# Altium schematic sheet Board3ph.SchDoc
size 594 x 420 mm; DrawnBy: A.C; Address1: WATTNOW Rue Lac Victoria; Address2: Les Berges du Lac, Tunisia.; Revision: B; SheetNumber: 1; SheetTotal: 1; EDA_Number: WN-XXXXX-VX-X; Projet: AC Energy Meter; ModifiedBy: -; CreateDate: 07/05/2020; CheckedDate: -; Title2: Daughter Board B; DivGrp: WN; Designer: A.C
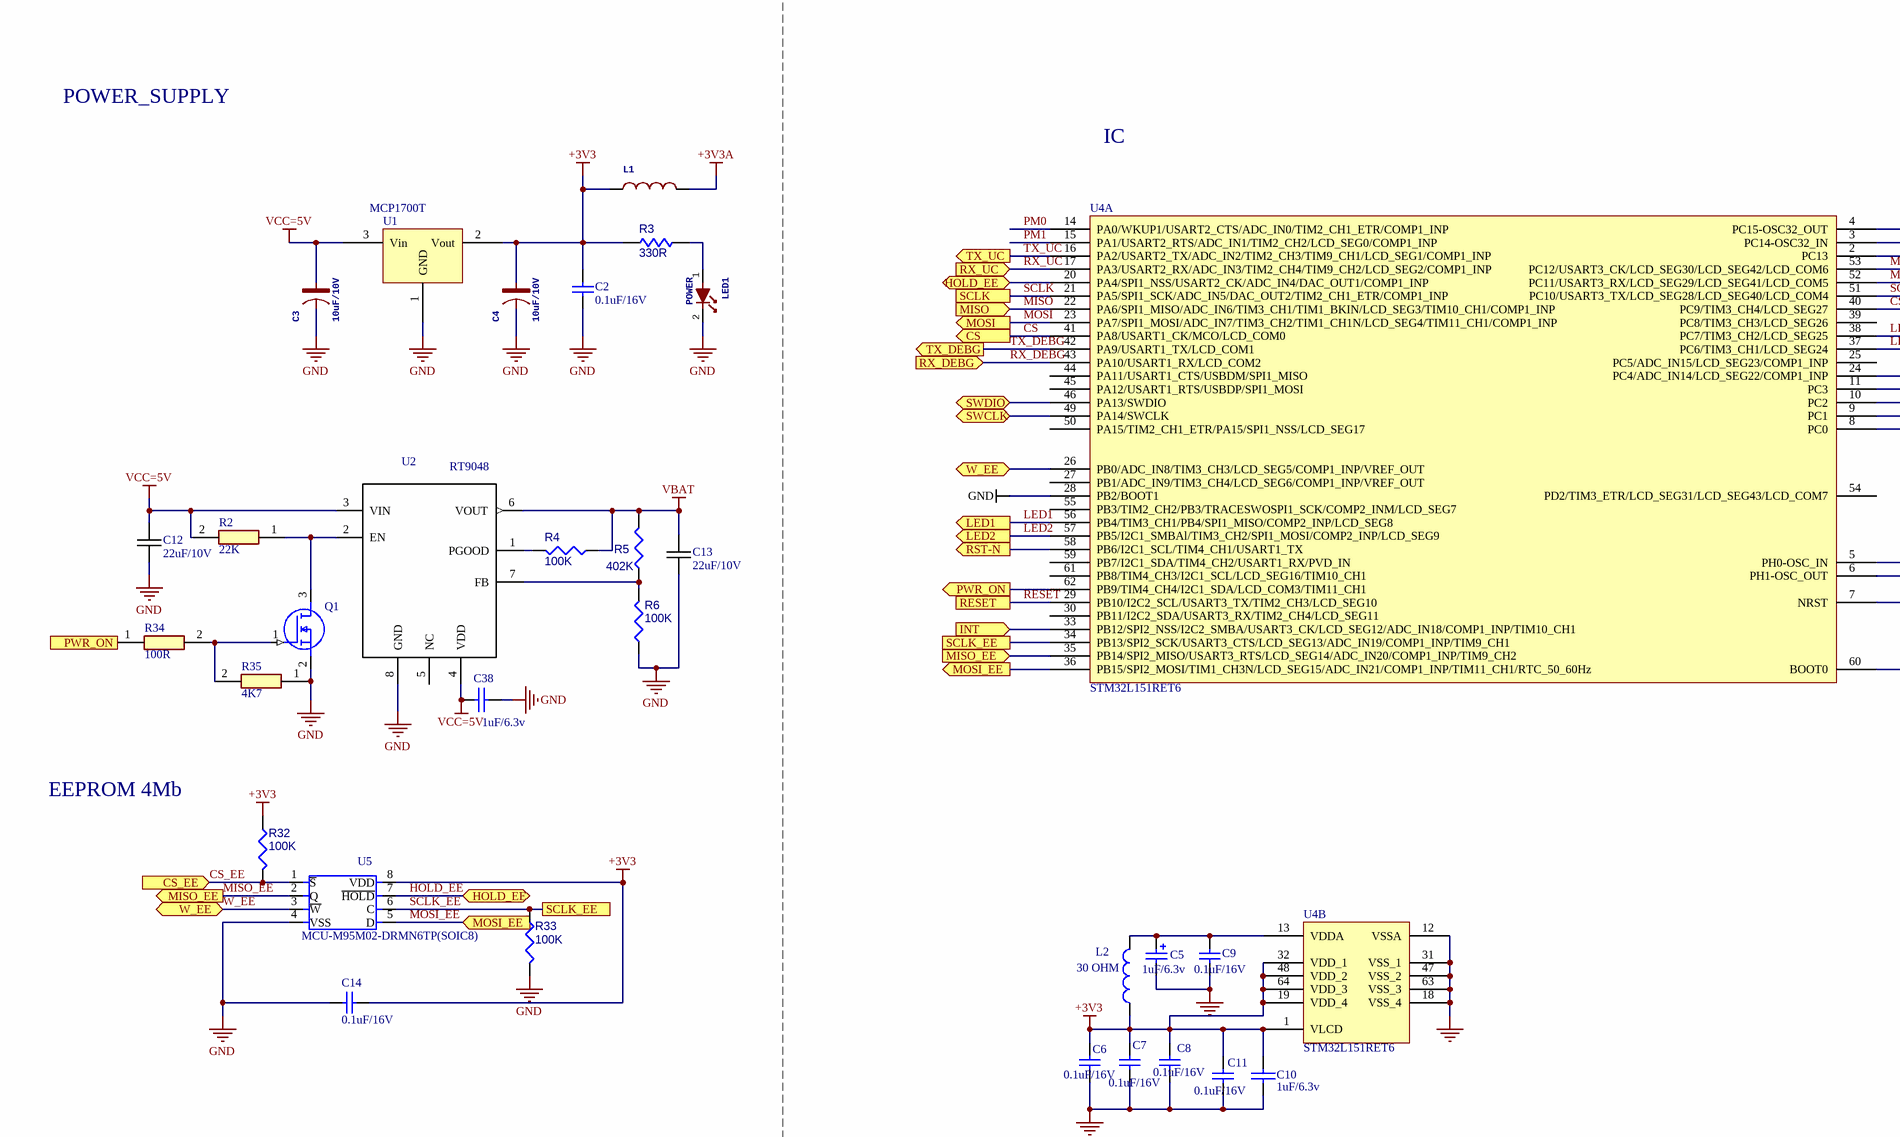
[diagram p0: Board3ph.SchDoc, top left]
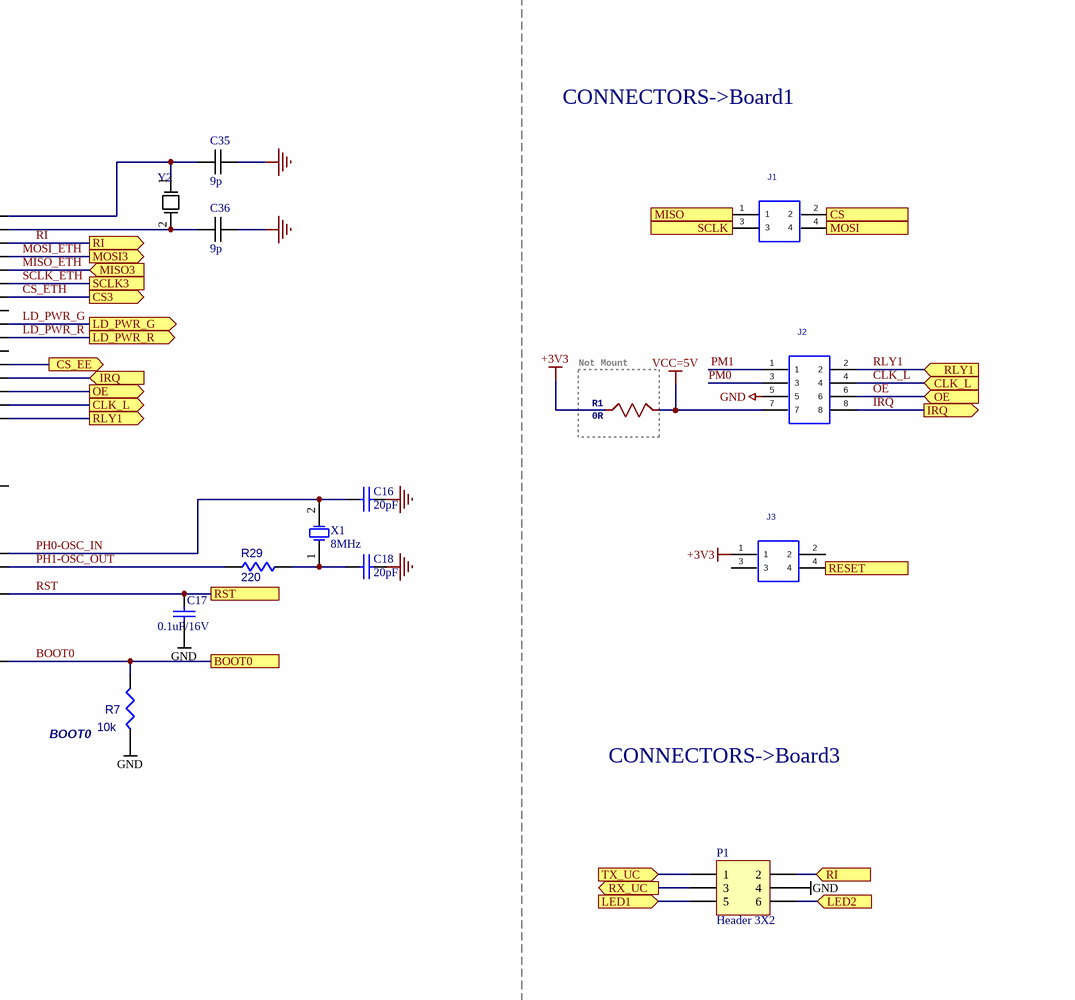
[diagram p1: Board3ph.SchDoc, top right]
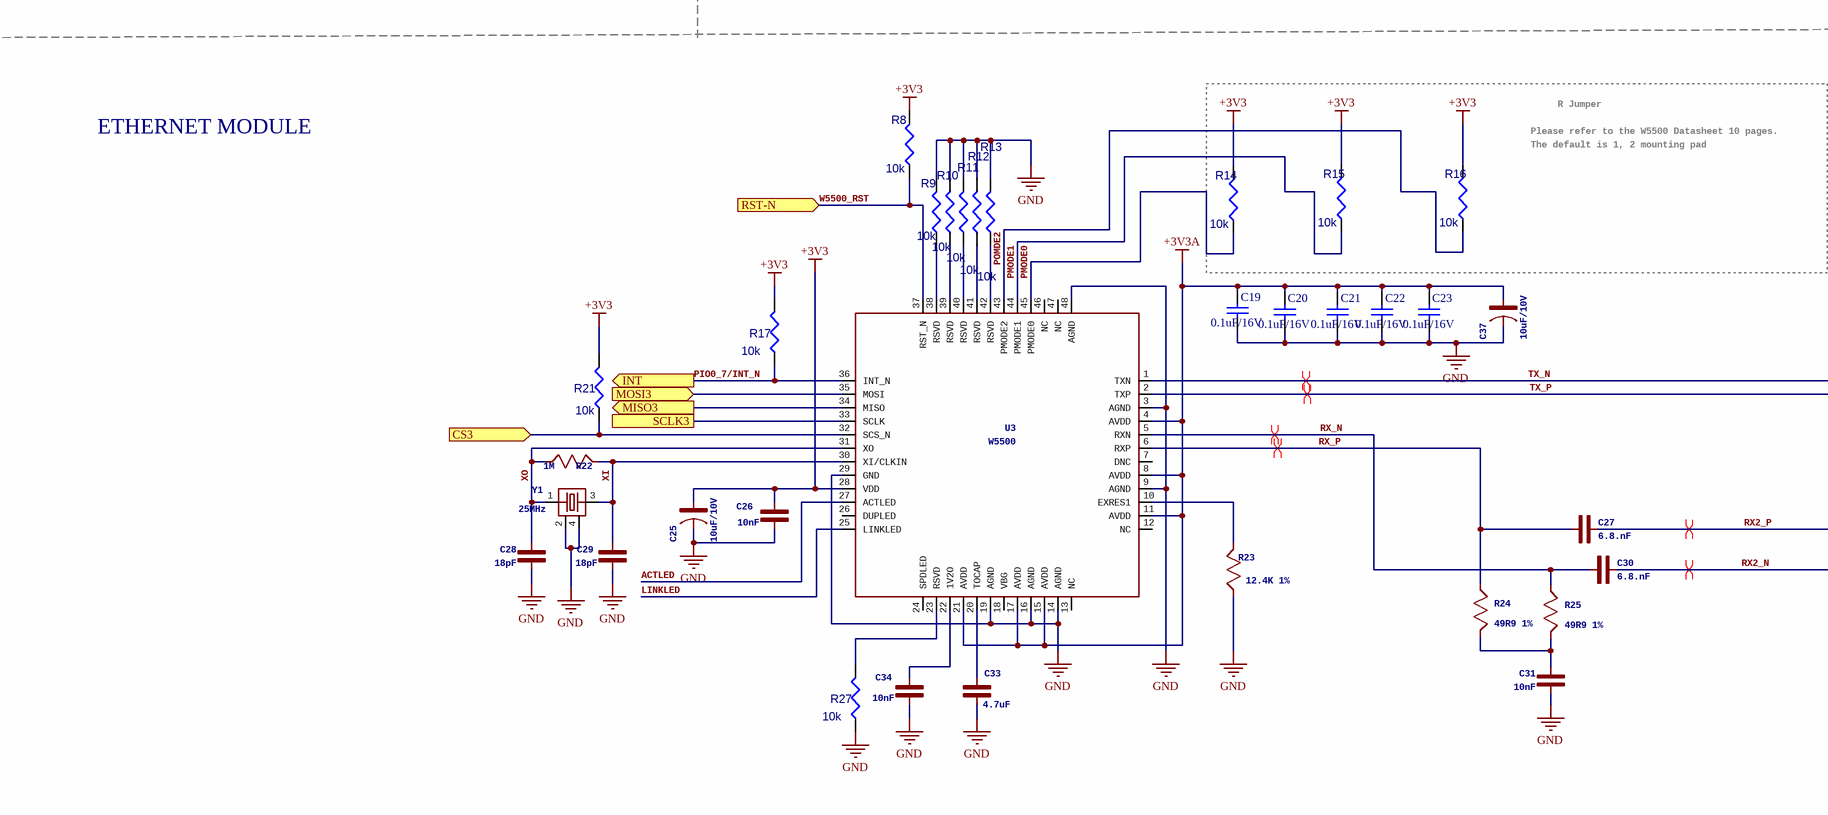
[diagram p2: Board3ph.SchDoc, bottom left]
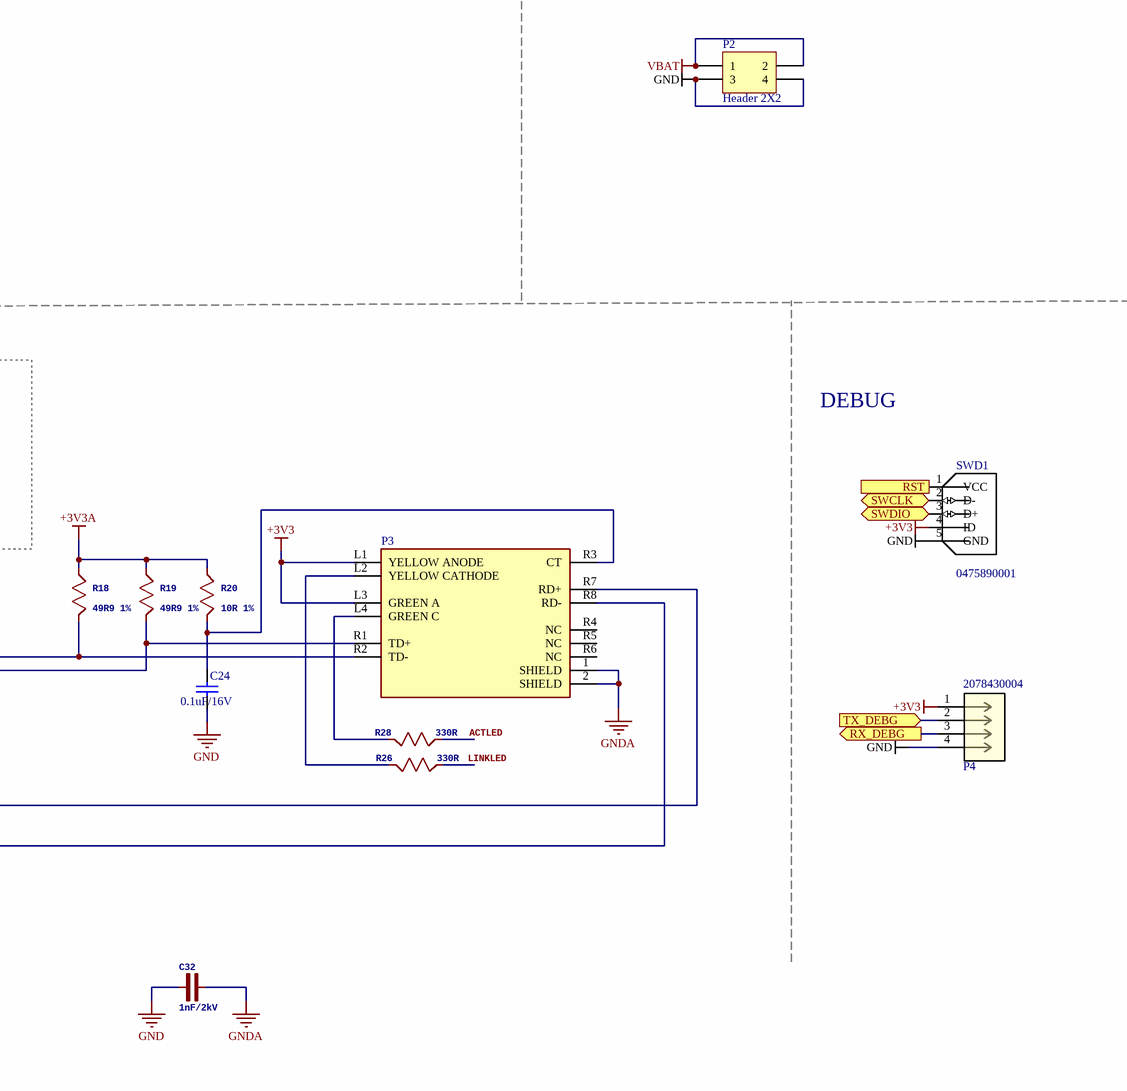
[diagram p3: Board3ph.SchDoc, bottom right]

## Parts
C2  0.1uF/16V  [0603C-TBD]
C3  10uF/10V  [C-3216(TANTAL) - INV]
C4  10uF/10V  [C-3216(TANTAL) - INV]
C5  1uF/6.3v  [C-2012 - TANT]
C6  0.1uF/16V  [0603C-TBD]
C7  0.1uF/16V  [0603C-TBD]
C8  0.1uF/16V  [0603C-TBD]
C9  0.1uF/16V  [0603C-TBD]
C10  1uF/6.3v  [0603C-TBD]
C11  0.1uF/16V  [0603C-TBD]
C12  22uF/10V  [C-3216(TANTAL)]
C13  22uF/10V  [C-3216(TANTAL)]
C14  0.1uF/16V  [0603C-TBD]
C16  20pF  [0603C-TBD]
C17  0.1uF/16V  [0603C-TBD]
C18  20pF  [0603C-TBD]
C19  0.1uF/16V  [0603C-TBD]
C20  0.1uF/16V  [0603C-TBD]
C21  0.1uF/16V  [0603C-TBD]
C22  0.1uF/16V  [0603C-TBD]
C23  0.1uF/16V  [0603C-TBD]
C24  0.1uF/16V  [0603C-TBD]
C25  10uF/10V  [C-3216(TANTAL)]
C26  10nF  [C-1608]
C27  6.8.nF  [C-1608]
C28  18pF  [C-1608]
C29  18pF  [C-1608]
C30  6.8.nF  [C-1608]
C31  10nF  [C-1608]
C32  1nF/2kV  [C-2012]
C33  4.7uF  [0603C-TBD]
C34  10nF  [C-1608]
C35  9p  [0603C-TBD]
C36  9p  [0603C-TBD]
C37  10uF/10V  [C-3216(TANTAL)]
C38  1uF/6.3v  [0603C-TBD]
J1  SFMC-102-X1-XX-D  [SFMC-102-X1-XX-D]  (value not drawn)
J2  SFMC-104-X1-XX-D  [SFMC-104-X1-XX-D]  (value not drawn)
J3  SFMC-102-X1-XX-D  [SFMC-102-X1-XX-D]  (value not drawn)
L1  GLFR1608T1R5M-LR  [L-1608]  (value not drawn)
L2  30 OHM  [0603C-TBD]
LED1  POWER  [LED-1608]
P1  Header 3X2  [3x2A 1.27 Double Samtec]
P2  Header 2X2  [2x2A 1.27 Double Samtec]
P3  Conn_WIZnet_RB1-125BAG1A_eec  [WIZnet_RB1-125BAG1A_0]  (value not drawn)
P4  2078430004  [CON_2078430004_MOL]
Q1  2N7002  [SOT23]  (value not drawn)
R1  0R  [R-1608]
R2  22K  [0603C-TBD]
R3  330R  [0603C-TBD]
R4  100K  [0603C-TBD]
R5  402K  [0603C-TBD]
R6  100K  [0603C-TBD]
R7  10k  [0603C-TBD]
R8  10k  [0603C-TBD]
R9  10k  [0603C-TBD]
R10  10k  [0603C-TBD]
R11  10k  [0603C-TBD]
R12  10k  [0603C-TBD]
R13  10k  [0603C-TBD]
R14  10k  [0603C-TBD]
R15  10k  [0603C-TBD]
R16  10k  [0603C-TBD]
R17  10k  [0603C-TBD]
R18  49R9 1%  [R-1608]
R19  49R9 1%  [R-1608]
R20  10R 1%  [R-1608]
R21  10k  [0603C-TBD]
R22  1M  [R-1608]
R23  12.4K 1%  [R-1608]
R24  49R9 1%  [R-1608]
R25  49R9 1%  [R-1608]
R26  330R  [R-1608]
R27  10k  [0603C-TBD]
R28  330R  [R-1608]
R29  220  [0603C-TBD]
R32  100K  [0603C-TBD]
R33  100K  [0603C-TBD]
R34  100R  [0603C-TBD]
R35  4K7  [0603C-TBD]
SWD1  0475890001  [MOLEX_0475890001]
U1  MCP1700T  [SOT23]
U2  RT9048  [SOIC127P600X175-8N]
U3  W5500  [W5500]
U4  STM32L151RET6  [STM-LQFP64_V]  (parts A,B of 2)
U5  MCU-M95M02-DRMN6TP(SOIC8)  [SOIC8-1.27-5X4MM]
X1  8MHz  [XTAL_HC49P488W43L1150T466H350]
Y1  25MHz  [XTAL3225]
Y2  CM8V-T1A-32.768KHZ-9PF-20PPM-TA-QC  [XTAL_CM8V-T1A-32.768KHZ-9PF-20PPM-TA-QC]  (value not drawn)

## Blocks framed on the sheet
Not Mount: R1

## Ports
BOOT0, CLK_L (in), CLK_L (out), CS3 (in), CS3 (out), CS (in), CS (out), CS_EE (in), CS_EE (out), HOLD_EE (bidir), INT (in), INT (out), IRQ (in), IRQ (out), LD_PWR_G (out), LD_PWR_R (out), LED1 (in), LED1 (out), LED2 (in), LED2 (out), MISO3 (in), MISO3 (out), MISO (in), MISO (out), MISO_EE (in), MISO_EE (out), MOSI3 (in), MOSI3 (out), MOSI (in), MOSI (out), MOSI_EE (in), MOSI_EE (out), OE (in), OE (out), PWR_ON (in), PWR_ON (out), RESET, RI (in), RI (out), RLY1 (in), RLY1 (out), RST, RST-N (in), RST-N (out), RX_DEBG (in), RX_DEBG (out), RX_UC (in), RX_UC (out), SCLK, SCLK3, SCLK_EE, SWCLK (bidir), SWDIO (bidir), TX_DEBG (in), TX_DEBG (out), TX_UC (in), TX_UC (out), W_EE (bidir)

## Nets
+3V3: C2.2 C4.1 C6.2 C7.2 C8.2 C10.1 C11.2 C14.1 C25.1 C26.2(P$2) J3.1 L1.1 L2.1 P3.L1(YELLOW_ANODE) P3.L3(GREEN_A) P4.1 R1.2(P$2) R3.1 R8.2 R14.2 R15.2 R16.2 R17.2 R21.2 R32.1 SWD1.4(ID) U1.2(Vout) U3.28(VDD) U4.1(VLCD) U4.19(VDD_4) U4.32(VDD_1) U4.48(VDD_2) U4.64(VDD_3) U5.8(VDD)
+3V3A: C19.2 C20.2 C21.2 C22.2 C23.2 C37.1 L1.2 R18.2(P$2) R19.2(P$2) R20.2(P$2) U3.4(AVDD) U3.8(AVDD) U3.11(AVDD) U3.15(AVDD) U3.17(AVDD) U3.21(AVDD)
GND: C2.1 C3.2 C4.2 C5.2 C6.1 C7.1 C8.1 C9.1 C10.2 C11.1 C12.1 C13.1 C14.2 C16.1 C17.1 C18.1 C19.1 C20.1 C21.1 C22.1 C23.1 C24.1 C25.2 C26.1(P$1) C28.1(P$1) C29.1(P$1) C31.1(P$1) C32.1(P$1) C33.1 C34.1(P$1) C35.2 C36.2 C37.2 C38.2 J2.5 LED1.2(P$2) P1.4 P2.3 P2.4 P4.4 Q1.2(S) R6.1 R7.1 R9.2 R10.2 R11.2 R12.2 R13.2 R23.1(P$1) R27.1 R33.2 R35.1 SWD1.5(GND) U1.1(GND) U2.8(GND) U3.3(AGND) U3.9(AGND) U3.14(AGND) U3.16(AGND) U3.19(AGND) U3.29(GND) U3.48(AGND) U4.12(VSSA) U4.18(VSS_4) U4.28(PB2/BOOT1) U4.31(VSS_1) U4.47(VSS_2) U4.63(VSS_3) U5.4(VSS) Y1.2 Y1.4
GNDA: C32.2(P$2) P3.1(SHIELD) P3.2(SHIELD)
VBAT: C13.2 P2.1 P2.2 R4.1 R5.2 U2.6(VOUT)
VCC=5V: C3.1 C12.2 C38.1 J2.7 R1.1(P$1) R2.2 U1.3(Vin) U2.3(VIN) U2.4(VDD)
ACTLED: R28.2(P$2) U3.27(ACTLED)
BOOT0: R7.2 U4.60(BOOT0) ; port BOOT0
CLK_L: J2.4 U4.9(PC1) ; port CLK_L
CS: J1.2 U4.41(PA8/USART1_CK/MCO/LCD_COM0) ; port CS
CS_EE: R32.2 U4.24(PC4/ADC_IN14/LCD_SEG22/COMP1_INP) U5.1(~{S}) ; port CS_EE
CS_ETH: R21.1 U3.32(SCS_N) U4.40(PC9/TIM3_CH4/LCD_SEG27) ; port CS3
HOLD_EE: U4.20(PA4/SPI1_NSS/USART2_CK/ADC_IN4/DAC_OUT1/COMP1_INP) U5.7(~{HOLD}) ; port HOLD_EE
IRQ: J2.8 U4.11(PC3) ; port IRQ
LD_PWR_G: U4.38(PC7/TIM3_CH2/LCD_SEG25) ; port LD_PWR_G
LD_PWR_R: U4.37(PC6/TIM3_CH1/LCD_SEG24) ; port LD_PWR_R
LED1: P1.5 U4.56(PB4/TIM3_CH1/PB4/SPI1_MISO/COMP2_INP/LCD_SEG8) ; port LED1
LED2: P1.6 U4.57(PB5/I2C1_SMBAl/TIM3_CH2/SPI1_MOSI/COMP2_INP/LCD_SEG9) ; port LED2
LINKLED: R26.2(P$2) U3.25(LINKLED)
MISO: J1.1 U4.22(PA6/SPI1_MISO/ADC_IN6/TIM3_CH1/TIM1_BKIN/LCD_SEG3/TIM10_CH1/COMP1_INP) ; port MISO
MISO_EE: U4.35(PB14/SPI2_MISO/USART3_RTS/LCD_SEG14/ADC_IN20/COMP1_INP/TIM9_CH2) U5.2(Q) ; port MISO_EE
MISO_ETH: U3.34(MISO) U4.52(PC11/USART3_RX/LCD_SEG29/LCD_SEG41/LCD_COM5) ; port MISO3
MOSI: J1.4 U4.23(PA7/SPI1_MOSI/ADC_IN7/TIM3_CH2/TIM1_CH1N/LCD_SEG4/TIM11_CH1/COMP1_INP) ; port MOSI
MOSI_EE: U4.36(PB15/SPI2_MOSI/TIM1_CH3N/LCD_SEG15/ADC_IN21/COMP1_INP/TIM11_CH1/RTC_50_60Hz) U5.5(D) ; port MOSI_EE
MOSI_ETH: U3.35(MOSI) U4.53(PC12/USART3_CK/LCD_SEG30/LCD_SEG42/LCD_COM6) ; port MOSI3
OE: J2.6 U4.10(PC2) ; port OE
PH0-OSC_IN: C16.2 U4.5(PH0-OSC_IN) X1.2(OSC2)
PH1-OSC_OUT: R29.1 U4.6(PH1-OSC_OUT)
PIO0_7/INT_N: R17.1 U3.36(INT_N) U4.33(PB12/SPI2_NSS/I2C2_SMBA/USART3_CK/LCD_SEG12/ADC_IN18/COMP1_INP/TIM10_CH1) ; port INT
PM0: J2.3 U4.14(PA0/WKUP1/USART2_CTS/ADC_IN0/TIM2_CH1_ETR/COMP1_INP)
PM1: J2.1 U4.15(PA1/USART2_RTS/ADC_IN1/TIM2_CH2/LCD_SEG0/COMP1_INP)
PMODE0: R14.1 U3.45(PMODE0)
PMODE1: R15.1 U3.44(PMODE1)
POMDE2: R16.1 U3.43(PMODE2)
PWR_ON: R34.1 U4.62(PB9/TIM4_CH4/I2C1_SDA/LCD_COM3/TIM11_CH1) ; port PWR_ON
RESET: J3.4 U4.29(PB10/I2C2_SCL/USART3_TX/TIM2_CH3/LCD_SEG10) ; port RESET
RI: P1.2 U4.2(PC13) ; port RI
RLY1: J2.2 U4.8(PC0) ; port RLY1
RST: C17.2 SWD1.1(VCC) U4.7(NRST) ; port RST
RX2_N: C30.1(P$1) P3.R8(RD-)
RX2_P: C27.1(P$1) P3.R7(RD+)
RX_DEBG: P4.3 U4.43(PA10/USART1_RX/LCD_COM2) ; port RX_DEBG
RX_N: C30.2(P$2) R25.2(P$2) U3.5(RXN)
RX_P: C27.2(P$2) R24.2(P$2) U3.6(RXP)
RX_UC: P1.3 U4.17(PA3/USART2_RX/ADC_IN3/TIM2_CH4/TIM9_CH2/LCD_SEG2/COMP1_INP) ; port RX_UC
SCLK: J1.3 U4.21(PA5/SPI1_SCK/ADC_IN5/DAC_OUT2/TIM2_CH1_ETR/COMP1_INP) ; port SCLK
SCLK_EE: R33.1 U4.34(PB13/SPI2_SCK/USART3_CTS/LCD_SEG13/ADC_IN19/COMP1_INP/TIM9_CH1) U5.6(C) ; port SCLK_EE
SCLK_ETH: U3.33(SCLK) U4.51(PC10/USART3_TX/LCD_SEG28/LCD_SEG40/LCD_COM4) ; port SCLK3
SWCLK: SWD1.2(D-) U4.49(PA14/SWCLK) ; port SWCLK
SWDIO: SWD1.3(D+) U4.46(PA13/SWDIO) ; port SWDIO
TX_DEBG: P4.2 U4.42(PA9/USART1_TX/LCD_COM1) ; port TX_DEBG
TX_N: P3.R2(TD-) R18.1(P$1) U3.1(TXN)
TX_P: P3.R1(TD+) R19.1(P$1) U3.2(TXP)
TX_UC: P1.1 U4.16(PA2/USART2_TX/ADC_IN2/TIM2_CH3/TIM9_CH1/LCD_SEG1/COMP1_INP) ; port TX_UC
W5500_RST: R8.1 U3.37(RST_N) U4.58(PB6/I2C1_SCL/TIM4_CH1/USART1_TX) ; port RST-N
W_EE: U4.26(PB0/ADC_IN8/TIM3_CH3/LCD_SEG5/COMP1_INP/VREF_OUT) U5.3(~{W}) ; port W_EE
XI: C29.2(P$2) R22.2(P$2) U3.30(XI/CLKIN) Y1.3
XO: C28.2(P$2) R22.1(P$1) U3.31(XO) Y1.1
NetC5_1: C5.1 C9.2 L2.2 U4.13(VDDA)
NetC18_2: C18.2 R29.2 X1.1(OSC1)
NetC24_2: C24.2 P3.R3(CT) R20.1(P$1)
NetC31_2: C31.2(P$2) R24.1(P$1) R25.1(P$1)
NetC33_2: C33.2 U3.20(TOCAP)
NetC34_2: C34.2(P$2) U3.22(1V2O)
NetC35_1: C35.1 U4.4(PC15-OSC32_OUT) Y2.1
NetC36_1: C36.1 U4.3(PC14-OSC32_IN) Y2.2
NetLED1_1: LED1.1(P$1) R3.2
NetP3_L2: P3.L2(YELLOW_CATHODE) R26.1(P$1)
NetP3_L4: P3.L4(GREEN_C) R28.1(P$1)
NetQ1_1: Q1.1(G) R34.2 R35.2
NetQ1_3: Q1.3(D) R2.1 U2.2(EN)
NetR4_2: R4.2 U2.1(PGOOD)
NetR5_1: R5.1 R6.2 U2.7(FB)
NetR9_1: R9.1 U3.38(RSVD)
NetR10_1: R10.1 U3.39(RSVD)
NetR11_1: R11.1 U3.40(RSVD)
NetR12_1: R12.1 U3.41(RSVD)
NetR13_1: R13.1 U3.42(RSVD)
NetR23_2: R23.2(P$2) U3.10(EXRES1)
NetR27_2: R27.2 U3.23(RSVD)

Not connected (* = marked no-connect by the designer): J3 2 3; P3 R4(NC) R5(NC) R6(NC); U2 5(NC); U3 7(DNC) 12(NC) 13(NC) 18(VBG) 24(SPDLED) 26(DUPLED) 46(NC) 47(NC); U4 25(PC5/ADC_IN15/LCD_SEG23/COMP1_INP) 27(PB1/ADC_IN9/TIM3_CH4/LCD_SEG6/COMP1_INP/VREF_OUT) 30(PB11/I2C2_SDA/USART3_RX/TIM2_CH4/LCD_SEG11) 39(PC8/TIM3_CH3/LCD_SEG26) 44(PA11/USART1_CTS/USBDM/SPI1_MISO) 45(PA12/USART1_RTS/USBDP/SPI1_MOSI) 50(PA15/TIM2_CH1_ETR/PA15/SPI1_NSS/LCD_SEG17) 54(PD2/TIM3_ETR/LCD_SEG31/LCD_SEG43/LCD_COM7) 55(PB3/TIM2_CH2/PB3/TRACESWOSPI1_SCK/COMP2_INM/LCD_SEG7) 59(PB7/I2C1_SDA/TIM4_CH2/USART1_RX/PVD_IN) 61(PB8/TIM4_CH3/I2C1_SCL/LCD_SEG16/TIM10_CH1)

## Layout directives
differential pair; net class Diff100: RX2_N, RX2_P, RX_N, RX_P, TX_N, TX_P

## Notes on the sheet
- POWER_SUPPLY
- CONNECTORS->Board1
- IC
- EEPROM 4Mb
- (near R7) BOOT0
- CONNECTORS->Board3
- ETHERNET MODULE
- Please refer to the W5500 Datasheet 10 pages.
- The default is 1, 2 mounting pad
- R Jumper
- DEBUG
- Project/Equipment
- Document
- File
- Designer
- Drawn by
- Check.by
- Last Mod.
- Print Date
- Sheet
- Size
- A2
- of
- Rev

## Library data of the parts
C2 C6-C9 C11 C14 C17 C19-C24 = Cap: CAPACITOR 0603 CERAMIC; Manufacturer: Samsung; Manufacturer Part Number: CL10F104ZO8NNNC; Value: 100nF; Voltage Rating: 16V; Revision: July-2002: Re-released for DXP Platform.; Supplier 1: Digi-Key; Supplier Part Number 1: 1276-1258-1-ND; Capacitance: 100nF; Case Code (Metric): 1608; Category: Ceramic Capacitors
C3 C4 = C-3216(TANTAL): CAP TANT 10UF 10% 10V 1206  (3216); Manufacturer: Kyocera AVX; Manufacturer Part Number: TAJA106K006RNJ; Tolerance: 20%; Voltage: 6.3V; ComponentLink1Description: supplier; ComponentLink1URL: https://www.digikey.com/product-detail/en/avx-corporation/TAJA106K010RNJ/478-1654-1-ND/564686; Supplier 1: Digi-Key; Supplier Part Number 1: 478-1653-1-ND; Capacitance: 10uF; Case Code (Metric): 3216; Category: Tantalum Capacitors
C5 = Cap Pol1: Polarized Capacitor  1uF/16V TANTAL 0805; Manufacturer: Kyocera AVX; Manufacturer Part Number: F921C105MPA; Value: 1uF; Tolerance: 20%; Voltage Rating: 16V; Published: 8-Jun-2000; Revision: July-2002: Re-released for DXP Platform.; Publisher: Altium Limited; Supplier 1: Digi-Key; Supplier Part Number 1: 478-8126-1-ND; Case Code (Metric): 2012; Category: Tantalum Capacitors; Supplier Unit Price 1: $0.09899
C10 C38 = CAP: Capacitor 1uF 6.3V X5R 10% SMD 0603; Manufacturer: Samsung; Manufacturer Part Number: CL10A105KQ8NNNC; Value: 1uF; Supplier 1: Digi-Key; Supplier Part Number 1: 1276-1036-1-ND; Case Code (Metric): 1608; Category: Ceramic Capacitors; Dielectric: X5R; Tolerance: 10%; Voltage Rating: 6.3V; Supplier Unit Price 1: $0.00877
C12 C13 = 0805C-18PF-50V-C0G-JOH: Tantalum Capacitors - Solid SMD 10V 22uF 20%  3216 -1206; Manufacturer: Kyocera AVX; Manufacturer Part Number: TAJA226M010RNJ; Leakage Current: 2.2uA; Supplier 1: Digi-Key; Supplier Part Number 1: 478-5798-1-ND; Case Code (Metric): 3216; Category: Tantalum Capacitors
C16 C18 = CAP: Capacitor 20p 50v 0603; Manufacturer: Samsung; Manufacturer Part Number: CL10C200JB8NNNC; Temperature Coefficient: 300ppm/°C; Tolerance: 5%; Value: 20pF; Supplier 1: Digi-Key; Supplier Part Number 1: 1276-1187-1-ND; Capacitance: 20pF; Case Code (Metric): 1608; Category: Ceramic Capacitors; Voltage: 50V; Supplier Unit Price 1: $0.0134
C25 C37 = C-3216(TANTAL): CAP TANT 10UF 10% 10V 1206  (3216); Manufacturer: Kyocera AVX; Manufacturer Part Number: TAJA106K010RNJ; ESR (Equivalent Series Resistance): 3R; ComponentLink1Description: supplier; ComponentLink1URL: https://www.digikey.com/product-detail/en/avx-corporation/TAJA106K010RNJ/478-1654-1-ND/564686; Supplier 1: Digi-Key; Supplier Part Number 1: 478-1654-1-ND; Capacitance: 10uF; Case Code (Metric): 3216; Category: Tantalum Capacitors; Tolerance: 10%; Voltage: 10V
C26 C31 C34 = C-1608: Multilayer Ceramic Capacitors MLCC - SMD/SMT 16V 0.01uF 0603 X8R 5%; Manufacturer: KEMET; Manufacturer Part Number: C0603X103J4HACTU; Supplier 1: Mouser; Supplier Part Number 1: 80-C0603X103J4HACTU; Supplier Unit Price 1: $0.024
C27 C30 = C-1608: 6800pF ±10% 200V Ceramic Capacitor X7R 0603 (1608 Metric); Manufacturer: KEMET; Manufacturer Part Number: C0603C682K2RECAUTO; Capacitance: 6.8nF; Supplier 1: Digi-Key; Supplier Part Number 1: 399-14765-1-ND; Case Code (Metric): 1608; Category: Ceramic Capacitors; Tolerance: 10%; Supplier Unit Price 1: $0.05209
C28 C29 = C-1608: 18pF ±5% 50V Ceramic Capacitor C0G, NP0 0603 (1608 Metric); Manufacturer: Samsung; Manufacturer Part Number: CL10C180JB8NNNC; Temperature Coefficient: 300ppm/°C; Supplier 1: Digi-Key; Supplier Part Number 1: 1276-1089-1-ND; Capacitance: 18pF; Case Code (Metric): 1608; Category: Ceramic Capacitors; Mount: Surface Mount; Tolerance: 5%; Supplier Unit Price 1: $0.01549
C32 = C-4520: 1000pF ±10% 1000V (1kV) Ceramic Capacitor X7R 0805 (2012 Metric); Manufacturer: KEMET; Manufacturer Part Number: C0805C102KDRACAUTO; Capacitance: 1nF; Supplier 1: Digi-Key; Supplier Part Number 1: 399-16643-1-ND; Case/Package: 0805; Category: Capacitors; Tolerance: 10%; Voltage Rating: 1kV; Supplier Unit Price 1: $0.13364
C33 = C-2012: CAP CER 4,7UF 10V X5R 0603; Tolerance: 10%; Voltage Rating: 25V; Capacitance: 4.7uF; Case Code (Imperial): 0603; Category: Ceramic Capacitors; Dielectric: X5R; Supplier Unit Price 1: $0.05773
C35 C36 = 0603C: CAPACITOR 0603 CERAMIC  9p 50V; Manufacturer Part Number: CGA3E2NP01H090D080AA; Manufacturer: TDK; Capacitance: 9pF; Dielectric: C0G; Case Code (Imperial): 0603; Case Code (Metric): 1608; Category: Ceramic Capacitors; Features: High Temperature; Resistor Type: Ceramic; Ratings: AEC-Q200; Supplier 1: Digi-Key; Supplier Part Number 1: 445-12433-1-ND; Supplier Unit Price 1: $0.20
J1 J3 = SFMC-102-X1-XX-D: Socket Strip, Cuttable, Double Row, 0.050"x0.050" Pitch; MANUFACTURER: SAMTEC; PCB DECAL: SFMC-104-X1-XX-D; System: Connector; CREATED: JUNE 03,  2014 - WENDY XIN
J2 = SFMC-104-X1-XX-D: Socket Strip, Cuttable, Double Row, 0.050"x0.050" Pitch; MANUFACTURER: SAMTEC; System: Connector; CREATED: JUNE 03,  2014 - WENDY XIN; PCB DECAL: SFMC-104-X1-XX-D
L1 = L-1608: FIXED IND 1.5UH 625MA 150 MOHM; Manufacturer: TDK; Shielding: Shielded; Tolerance: 20%; Supplier 1: Digi-Key; Supplier Part Number 1: 445-6152-1-ND; Case Code (Metric): 1608; Category: Fixed Inductors; Composition: Wirewound; Current Rating: 625mA; Manufacturer Part Number: GLFR1608T1R5M-LR; Termination: SMD/SMT; Supplier Unit Price 1: $0.10971
L2 = Inductor: FERRITE BEAD 30 OHM 0603 1LN; Manufacturer: TDK; Manufacturer Part Number: MPZ1608S300ATAH0; Impedance: 30R; Tolerance: 25%; Test Frequency: 100MHz; Supplier 1: Digi-Key; Supplier Part Number 1: 445-1562-1-ND; Case Code (Metric): 1608; Category: Ferrite Beads and Chips
LED1 = LED-1608: LED RED CLEAR 2SMD 1.95V, 5mA; Manufacturer Part Number: 19-217/R6C-AL1M2VY/3T; Manufacturer: Everlight; Forward Voltage: 2.2V; Supplier 1: Digi-Key; Supplier Part Number 1: 1080-1585-1-ND; Case/Package: 0603; ComponentLink1URL: https://media.digikey.com/pdf/Data%20Sheets/Everlight%20PDFs/19-217-R6C-AL1M2VY-3T.pdf?src-supplier=Digi-Key; ComponentLink1Description: https://media.digikey.com/pdf/Data%20Sheets/Everlight%20PDFs/19-217-R6C-AL1M2VY-3T.pdf?src-supplier=Digi-Key
P1 = Header 3X2: CONN HDR 6POS 0.05 STACK T/H Dual row; Manufacturer: Samtec; Manufacturer Part Number: FW-03-04-L-D-200-100; System: Connector; Supplier 1: Samtec; Supplier Part Number 1: FW-03-04-L-D-200-100; Mount: TH
P2 = Header 2X2: CONN HDR 4POS 0.05 STACK T/H Dual row; Manufacturer: Samtec; Manufacturer Part Number: FW-02-04-L-D-200-100; System: Connector; Supplier 1: Samtec; Supplier Part Number 1: FW-02-04-L-D-200-100; Mount: TH
P3 = Conn_WIZnet_RB1-125BAG1A_eec: CONN MAGJACK 1PORT 100 BASE-T; ComponentLink2Description: Datasheet; Temperature: 0°C to +70°C; Supplier 2: Mouser; Supplier 1: Digi-Key; ComponentLink1URL: https://upverter.com/upn/revision/a90ddcab053b3c09/; Supplier Part Number 2: 950-RB1-125BAG1A; Supplier Part Number 1: 1278-1011-ND; ComponentLink1Description: Upverter; ComponentLink2URL: http://www.shopwiznet.com/lanotattachments/download/file/id/95/store/1/; RoHS: TRUE; Temperature Range Low: 0°C; Temperature Range High: +70°C
P4 = 2078430004: Connector Header Through Hole 4 position 0.098" (2.50mm); Manufacturer: Molex; Manufacturer Part Number: 207843-0004; Supplier 1: Digi-Key; Supplier Part Number 1: 900-2078430004-ND; Supplier Packaging 1: Tray; Supplier Unit Price 1: $0.43
Q1 = 2N7002: MOSFET N-CH 60V 115MA SOT23-3; Manufacturer_Name: Diodes Inc.; Manufacturer_Part_Number: DMN65D8L-7; Datasheet Link: https://www.diodes.com/assets/Datasheets/DMN65D8L.pdf; Height: 1mm; Mouser Part Number: 621-DMN65D8L-7; Supplier 1: Digi-Key; Supplier Part Number 1: 2N7002E-T1-E3CT-ND
R1 = R-1608: 0 Ohms Jumper 0.1W, 1/10W Chip Resistor 0603 (1608 Metric) Moisture Resistant Thick Film; Manufacturer Part Number: RC0603JR-070RL; Manufacturer: Yageo; Power Rating: 100mW; Temperature Coefficient: 200ppm/°C; Tolerance: 1%; Voltage Rating: 50V; Supplier 1: Digi-Key; Supplier Part Number 1: 311-0.0GRDKR-ND; Case Code (Metric): 1608; Category: Chip SMD Resistors; Composition: Thick Film; Supplier Unit Price 1: $0.00347
R2 = 22K Ohm 0.5% 1/16W 0603: RES SMD 22K OHM 0.5% 1/16W 0603; Manufacturer: Susumu; Manufacturer Part Number: RR0816P-223-D; Max Power Dissipation: 63mW; Resistance: 22kR; Power Rating: 62.5mW; Temperature Coefficient: 25ppm/°C; Voltage Rating: 75V; Case Code (Metric): 1608; Category: Chip SMD Resistors; Tolerance: 0.5%; Supplier 1: Digi-Key; Supplier Part Number 1: RR08P22.0KDCT-ND; Supplier Unit Price 1: $0.01237
R3 = RES: Gen Purp Chip, R0603 0.1W 5%; Manufacturer: TE Connectivity; PartNumber: ERJ3GEYJ101V; Manufacturer Part Number: CRGCQ0603J330R; Value: 100; Component SubKind: Resistor; Voltage: 75; MetricFootprint: R1608MM; Max Power Dissipation: 100mW; Temperature Coefficient: 100ppm/°C; Material: Thick-Film; Watts: 0.1W; RoHS: Yes; Published: 7/16/2009; Publisher: AltiumDBManager1.1; Component Type: Standard; Pin Count: 2; Supplier 1: Digi-Key; Supplier Part Number 1: A130088CT-ND; Case Code (Metric): 1608; Composition: Thick Film; Resistance: 330R; ComponentLink1URL: https://www.te.com/commerce/DocumentDelivery/DDEController?Action=srchrtrv&amp;DocNm=1773204-3&amp;DocType=DS&amp;DocLang=English&src-supplier=Digi-Key; ComponentLink1Description: https://www.te.com/commerce/DocumentDelivery/DDEController?Action=srchrtrv&amp;DocNm=1773204-3&amp;DocType=DS&amp;DocLang=English&src-supplier=Digi-Key
R4 R6 = RES1: RES SMD 100K OHM 1% 1/4W 0603; Manufacturer: Vishay Dale; Manufacturer Part Number: RCA0603100KFKEAHP; Max Power Dissipation: 250mW; Resistance: 100kR; Temperature Coefficient: 100ppm/°C; Supplier 1: Digi-Key; Supplier Part Number 1: 541-3247-1-ND; Case Code (Metric): 1608; Composition: Thick Film; Tolerance: 1%; Supplier Unit Price 1: $0.03376; ComponentLink1URL: http://www.vishay.com/docs/20067/rcahp.pdf?src-supplier=Digi-Key; ComponentLink1Description: http://www.vishay.com/docs/20067/rcahp.pdf?src-supplier=Digi-Key
R5 = RES1: RES SMD 715K OHM 1% 1/10W 0603; Manufacturer: Yageo; Manufacturer Part Number: RC0603FR-07402KL; Max Power Dissipation: 100mW; Resistance: 402kR; Temperature Coefficient: 100ppm/°C; Voltage Rating (DC): 50V; Case Code (Metric): 1608; Category: Chip SMD Resistors; Resistor Type: Thick Film; Size Code: 0603; Tolerance: 1%; Supplier 1: Digi-Key; Supplier Part Number 1: 311-402KHRCT-ND; Supplier Unit Price 1: $0.10
R7-R17 R21 R27 = RES1: RES SMD 10K OHM 0.5% 1/16W 0603; Manufacturer: Susumu; Manufacturer Part Number: RR0816P-103-D; Max Power Dissipation: 63mW; Resistance: 10kR; Supplier 1: Digi-Key; Supplier Part Number 1: RR08P10.0KDCT-ND; Case Code (Metric): 1608; Category: Chip SMD Resistors; Termination: SMD/SMT; Tolerance: 0.5%; Supplier Unit Price 1: $0.0136
R18 R19 R24 R25 = R-1608: RES SMD 49.9 OHM 1% 1/10W 0603; Manufacturer: Yageo; Manufacturer Part Number: RC0603FR-0749R9L; Power Rating: 100mW; Resistance: 49.9R; Temperature Coefficient: 100ppm/°C; Voltage Rating: 50V; Supplier 1: Digi-Key; Supplier Part Number 1: 311-49.9HRDKR-ND; Case Code (Metric): 1608; Category: Chip SMD Resistors; Tolerance: 1%; Supplier Unit Price 1: $0.00366
R20 = R-1608: RES SMD 10 OHM 1% 1/10W 0603; Manufacturer Part Number: RC0603FR-0710RL; Manufacturer: Yageo; Temperature Coefficient: 200ppm/°C; Supplier 1: Digi-Key; Supplier Part Number 1: 311-10.0HRCT-ND; Case Code (Metric): 1608; Category: Chip SMD Resistors; Resistance: 10R; Tolerance: 1%; Supplier Unit Price 1: $0.00729
R22 = R-1608: Resistor CRGCQ 0603 1M0 5%; Manufacturer: TE Connectivity; Manufacturer Part Number: CRGCQ0603J1M0; Max Power Dissipation: 100mW; Temperature Coefficient: 100ppm/°C; Resistance: 1MR; Supplier 1: Digi-Key; Supplier Part Number 1: A130109CT-ND; Case Code (Metric): 1608; Composition: Thick Film; Tolerance: 5%; Supplier Unit Price 1: $0.00336
R23 = R-1608: RESISTOR 0603 12.4K 1%; Supplier 1: Digi-Key; Supplier Part Number 1: P12.4KHCT-ND
R26 R28 = R-1608: 330 Ohms ±5% 0.1W, 1/10W Chip Resistor 0603; Manufacturer: TE Connectivity; Manufacturer Part Number: CRGCQ0603J330R; Max Power Dissipation: 100mW; Supplier 1: Digi-Key; Supplier Part Number 1: A130088CT-ND; Case Code (Metric): 1608; Composition: Thick Film; Tolerance: 5%; Supplier Unit Price 1: $0.00336
R29 = RES: 220 Ohms ±1% 0.1W, 1/10W Chip Resistor 0603 (1608 Metric) Moisture Resistant Thick Film; Manufacturer: Yageo; Manufacturer Part Number: RC0603FR-07220RL; Max Power Dissipation: 100mW; Voltage Rating: 50V; Supplier 1: Digi-Key; Supplier Part Number 1: 311-220HRCT-ND; Case Code (Metric): 1608; Category: Chip SMD Resistors; Tolerance: 1%; Supplier Unit Price 1: $0.00366
R32 R33 = RES1: RES SMD 100K OHM 1% 1/4W 0603; Manufacturer: Vishay Dale; Manufacturer Part Number: RCA0603100KFKEAHP; Max Power Dissipation: 250mW; Resistance: 100kR; Supplier 1: Digi-Key; Supplier Part Number 1: 541-3247-1-ND; Case Code (Metric): 1608; Tolerance: 1%; Supplier Unit Price 1: $0.03376
R34 = 100 Ohm 5% 1/10W 0603: RES 100 OHM 5% 1/10W 0603; Manufacturer: Stackpole Electronics; Manufacturer Part Number: RMCF0603JT100R; Temperature Coefficient: 100ppm/°C; Case Code (Metric): 1608; Features: Automotive AEC-Q200; Resistance: 100R; Tolerance: 5%; Supplier 1: Digi-Key; Supplier Part Number 1: RMCF0603JT100RCT-ND; Supplier Unit Price 1: $0.00207
R35 = 4K7 Ohm 5% 1/10W 0603: RES 4.7K OHM 5% 1/10W 0603; Manufacturer: Stackpole Electronics; Manufacturer Part Number: RMCF0603JT4K70; Temperature Coefficient: 200ppm/°C; Max Power Dissipation: 100mW; Supplier 1: Digi-Key; Supplier Part Number 1: RMCF0603JT4K70CT-ND; Case Code (Imperial): 0603; Category: Chip SMD Resistors; Features: Automotive AEC-Q200; Supplier Unit Price 1: $0.00207
SWD1 = 0475890001: CONN RCPT MICRO USB AB R/A SMD; Manufacturer: Molex; Manufacturer Part Number: 47589-0001; Contact Resistance: 40mR; Current Rating: 1.8A; Gender: Female; Number of Contacts: 5; Supplier 1: Digi-Key; Supplier Part Number 1: WM17143CT-ND; Category: USB Connectors; Mount: Surface Mount,PCB; Orientation: Right Angle; Supplier Unit Price 1: $0.48114; ComponentLink1URL: https://datasheet.ciiva.com/16148/0475890001-io-connectors-16148921.pdf?src-supplier=Onlinecomponents.com; ComponentLink1Description: https://datasheet.ciiva.com/16148/0475890001-io-connectors-16148921.pdf?src-supplier=Onlinecomponents.com
U1 = MCP1700T-3302E/TT: Voltage Regulator; LDO; SOT-23; PD 369.6mW; VO 3.3V; Regline +/-0.75%/V; Manufacturer: Microchip; Supplier 1: Digi-Key; Supplier Part Number 1: MCP1700T3302ETTCT-ND; Category: Voltage Regulators - Linear; Manufacturer Part Number: MCP1700T-3302E/TT; Supplier Unit Price 1: $0.28; ComponentLink1URL: https://datasheet.ciiva.com/2040/21826b-2040112.pdf?src-supplier=Digi-Key; ComponentLink1Description: https://datasheet.ciiva.com/2040/21826b-2040112.pdf?src-supplier=Digi-Key
U2 = RT9025-25GSP: High performance 2A ULDO linear regulator; Manufacturer: Richtek; Max Input Voltage: 5V; Dropout Voltage: 230mV; Case/Package: SOIC; Manufacturer Part Number: RT9025-25GSP; Max Output Current: 2A; Output Current: 2A; Supplier 1: Digi-Key; Supplier Part Number 1: 1028-1009-2-ND; Supplier Unit Price 1: $0.33814; Category: Voltage Regulators - Linear
U3 = W5500: Ethernet Controller 10/100 Base-T/TX PHY SPI Interface; Manufacturer: WIZnet; Max Supply Current: 132mA; Max Supply Voltage: 3.63V; Min Supply Voltage: 2.97V; SymbolName_1: W5500; LibraryName: WIZnet; DeviceSetName: W5500; Supplier 1: Digi-Key; Supplier Part Number 1: 1278-1021-ND; Case/Package: LQFP; Category: Integrated Circuits (ICs); Interface: SPI; Manufacturer Part Number: W5500
U4 = STM32L152RCT6: IC MCU 32BIT 512KB FLASH 64LQFP; Manufacturer: STMicroelectronics; Core Architecture: ARM; Frequency: 32MHz; RAM Size: 80KB; Max Supply Voltage: 3.6V; Min Supply Voltage: 1.8V; Case/Package: LQFP; Category: Microcontrollers; Manufacturer Part Number: STM32L151RET6; Memory Size: 512KB; Supplier 1: Digi-Key; Supplier Part Number 1: 497-17527-ND
U5 = MCU-M95M02-DRMN6TP(SOIC8): EEPROM Memory IC 2Mb _256K x 8_ SPI 5MHz 8-SO; Manufacturer: STMicroelectronics; Manufacturer Part Number: M95M02-DWMN3TP/K; ComponentLink1Description: Supplier; ComponentLink1URL: https://www.digikey.fr/product-detail/fr/stmicroelectronics/M95M04-DRMN6TP/497-M95M04-DRMN6TPDKR-ND/11482714; ComponentLink2Description: Datasheet; ComponentLink2URL: https://www.st.com/resource/en/datasheet/m95m04-dr.pdf; Case Code (Metric): SOIC-8; Memory Format: EEPROM; Memory Size: 2Mb; Supplier 1: Digi-Key; Supplier Part Number 1: 497-15597-2-ND; Supplier Unit Price 1: $2.15
X1 = XTAL: 8MHz ±30ppm Crystal 20pF 80 Ohms HC-49/US; Manufacturer: Fox Electronics; Manufacturer Part Number: FC4STCBMF8.0-BAG200; Supplier 1: Arrow; Supplier Part Number 1: FC4STCBMF8.0-BAG200; Supplier Unit Price 1: $0.2273
Y1 = XTAL3225: CRYSTAL 25.0000MHZ 8PF SMD; Manufacturer: Kyocera AVX; Manufacturer Part Number: CX3225CA25000D0HSSCC; ESR (Equivalent Series Resistance): 100R; Frequency Stability: 50ppm; Tolerance: 20ppm; ComponentLink1Description: Supplier; ComponentLink1URL: https://www.digikey.com/product-detail/en/kyocera-international-inc-electronic-components/CX3225CA25000D0HSSCC/1253-1142-1-ND/4453960; Supplier 1: Digi-Key; Supplier Part Number 1: 1253-1142-1-ND; Case/Package: SMD/SMT; Frequency: 25MHz; Load Capacitance: 8pF
Y2 = CM8V-T1A-32.768KHZ-9PF-20PPM-TA-QC: ABS25 Series 32.768 kHz Â±20 ppm 6 pF -40 to +85 Â°C SMT Low Frequency Crystal; Manufacturer Part Number: CM8V-T1A 32.768kHz 9pF +/-20ppm TA QC; Manufacturer: Micro Crystal; Frequency Tolerance: 20ppm; Load Capacitance: 9pF; Supplier 1: Digi-Key; Supplier Part Number 1: 2195-CM8V-T1A-32.768KHZ-9PF-20PPM-TA-QCCT-ND; Case/Package: SMD/SMT; Frequency: 32.768kHz; Length: 2mm; Supplier Unit Price 1: $0.66; Max Operating Temperature: 85°C; Min Operating Temperature: -40°C